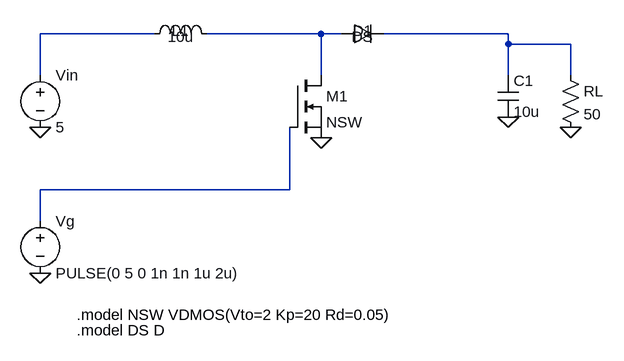
[diagram p0: schematic unseen_boost.asc]
unseen_boost.asc, the LTspice schematic file:
Version 4.1
SHEET 1 1600 1200
WIRE 112 0 -64 0
WIRE -64 0 -64 64
WIRE 400 0 368 0
WIRE 368 0 192 0
WIRE 368 64 368 0
WIRE 656 64 656 16
WIRE 656 16 656 0
WIRE 656 0 464 0
WIRE 752 64 752 16
WIRE 752 16 656 16
WIRE 320 144 320 240
WIRE 320 240 -64 240
WIRE -64 240 -64 288
FLAG -64 144 0
FLAG 368 160 0
FLAG -64 368 0
FLAG 656 128 0
FLAG 752 144 0
SYMBOL diode 400 16 R270
WINDOW 0 36 32 VBottom 2
WINDOW 3 -4 32 VTop 2
SYMATTR InstName D1
SYMATTR Value DS
SYMBOL ind 96 16 R270
WINDOW 0 36 56 VBottom 2
WINDOW 3 -4 56 VTop 2
SYMATTR InstName L1
SYMATTR Value 10u
SYMBOL cap 640 64 R0
SYMATTR InstName C1
SYMATTR Value 10u
SYMBOL nmos 320 64 R0
SYMATTR InstName M1
SYMATTR Value NSW
SYMBOL res 736 48 R0
SYMATTR InstName RL
SYMATTR Value 50
SYMBOL voltage -64 272 R0
SYMATTR InstName Vg
SYMATTR Value PULSE(0 5 0 1n 1n 1u 2u)
SYMBOL voltage -64 48 R0
SYMATTR InstName Vin
SYMATTR Value 5
TEXT -8 432 Left 2 !.model NSW VDMOS(Vto=2 Kp=20 Rd=0.05)
TEXT -8 456 Left 2 !.model DS D

The netlist it stands for:
* unseen_boost.asc
D1 N002 N003 DS
L1 N001 N002 10u
C1 N003 0 10u
M1 N002 N004 0 0 NSW
RL N003 0 50
Vg N004 0 PULSE(0 5 0 1n 1n 1u 2u)
Vin N001 0 5
.model D D
.lib standard.dio
.model NMOS NMOS
.model PMOS PMOS
.lib standard.mos
.model NSW VDMOS(Vto=2 Kp=20 Rd=0.05)
.model DS D
.backanno
.end